# Altium schematic sheet 09_FTDI_USB.SchDoc
size A3; SheetNumber: 4; SheetTotal: 21
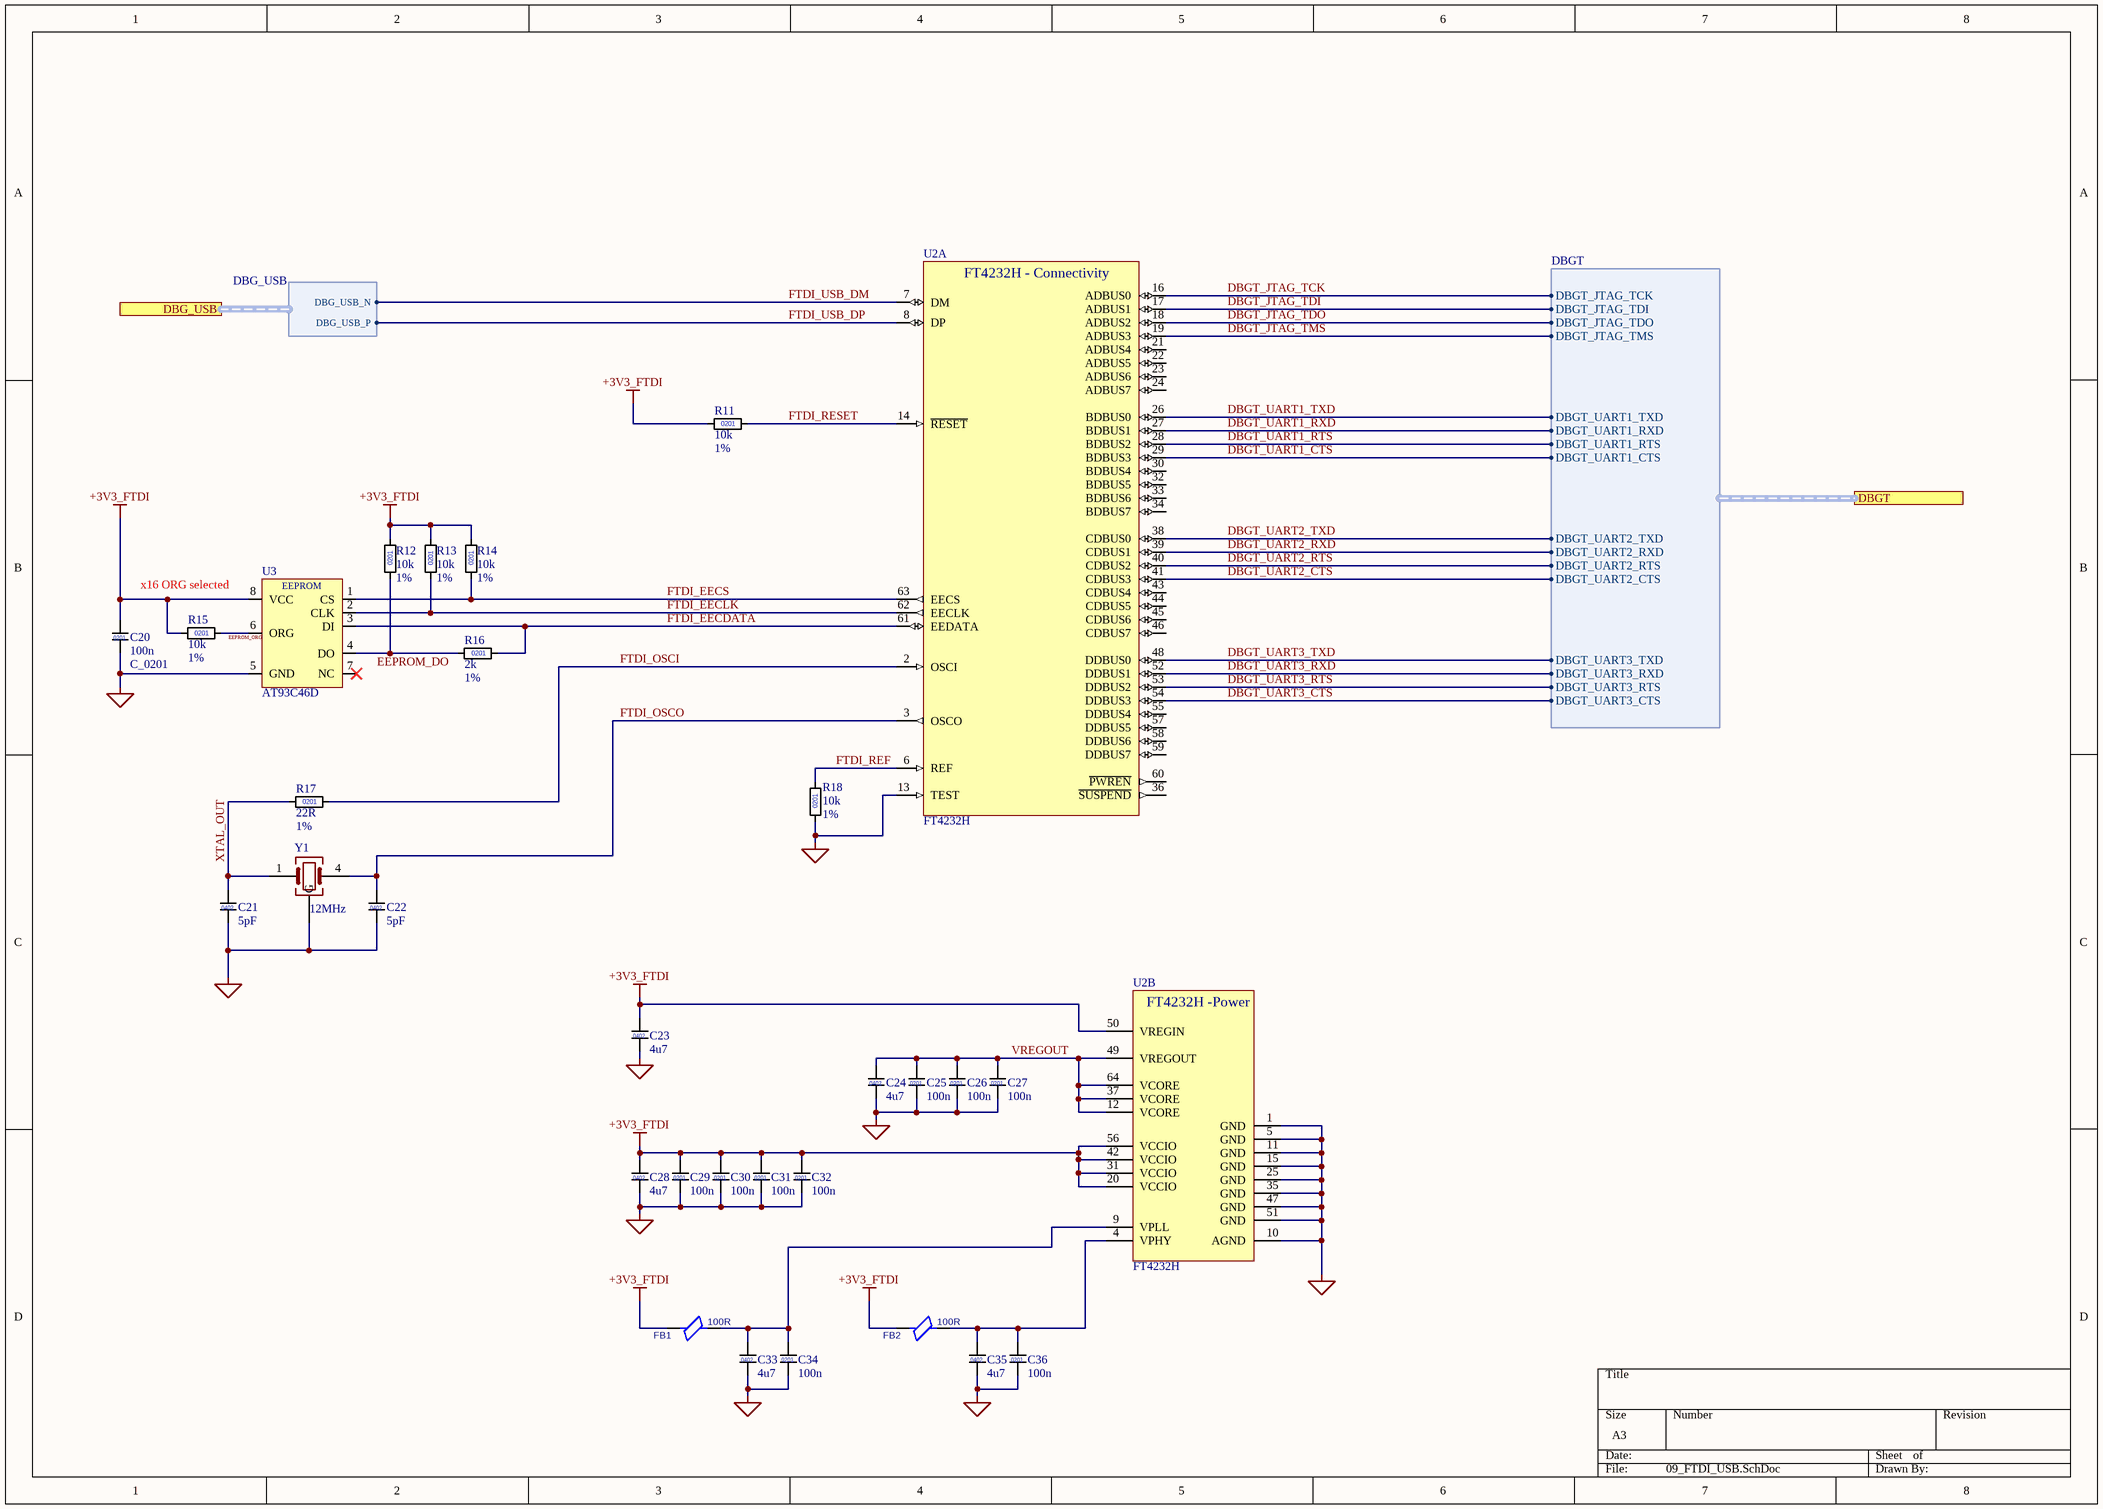
[diagram p0: 09_FTDI_USB.SchDoc]

## Parts
C20  C_0201  value 100n  [C0201]
C21  value 5pF  [C0201]  (hidden comment: C_0201)
C22  value 5pF  [C0201]  (hidden comment: C_0201)
C23  value 4u7  [C0402]  (hidden comment: C_0402)
C24  value 4u7  [C0402]  (hidden comment: C_0402)
C25  value 100n  [C0201]  (hidden comment: C_0201)
C26  value 100n  [C0201]  (hidden comment: C_0201)
C27  value 100n  [C0201]  (hidden comment: C_0201)
C28  value 4u7  [C0402]  (hidden comment: C_0402)
C29  value 100n  [C0201]  (hidden comment: C_0201)
C30  value 100n  [C0201]  (hidden comment: C_0201)
C31  value 100n  [C0201]  (hidden comment: C_0201)
C32  value 100n  [C0201]  (hidden comment: C_0201)
C33  value 4u7  [C0402]  (hidden comment: C_0402)
C34  value 100n  [C0201]  (hidden comment: C_0201)
C35  value 4u7  [C0402]  (hidden comment: C_0402)
C36  value 100n  [C0201]  (hidden comment: C_0201)
FB1  value 100R  [FB0201]  (hidden comment: FB_0201)
FB2  value 100R  [FB0201]  (hidden comment: FB_0201)
R11  value 10k  Tolerance: 1%  [R0201]  (hidden comment: 0201)
R12  value 10k  Tolerance: 1%  [R0201]  (hidden comment: 0201)
R13  value 10k  Tolerance: 1%  [R0201]  (hidden comment: 0201)
R14  value 10k  Tolerance: 1%  [R0201]  (hidden comment: 0201)
R15  value 10k  Tolerance: 1%  [R0201]  (hidden comment: 0201)
R16  value 2k  Tolerance: 1%  [R0201]  (hidden comment: 0201)
R17  value 22R  Tolerance: 1%  [R0201]  (hidden comment: 0201)
R18  value 10k  Tolerance: 1%  [R0201]  (hidden comment: 0201)
U2  FT4232H  [LQFP-64_10x10mm_P0.5mm]  (parts A,B of 2)
U3  AT93C46D
Y1  12MHz

## Ports
DBG_USB (harness DBG_USB), DBGT (harness DBGT, see SBC_SCH[2B], Voltage_Translator[1B])

## Harnesses
DBGT: DBGT_JTAG_TCK, DBGT_JTAG_TDI, DBGT_JTAG_TDO, DBGT_JTAG_TMS, DBGT_UART1_TXD, DBGT_UART1_RXD, DBGT_UART1_RTS, DBGT_UART1_CTS, DBGT_UART2_TXD, DBGT_UART2_RXD, DBGT_UART2_RTS, DBGT_UART2_CTS, DBGT_UART3_TXD, DBGT_UART3_RXD, DBGT_UART3_RTS, DBGT_UART3_CTS
DBG_USB: DBG_USB_N, DBG_USB_P

## Nets
+3V3_FTDI: C20.1 C23.1 C28.1 C29.1 C30.1 C31.1 C32.1 FB1.1 FB2.1 R11.1 R12.R? R13.R? R14.R? R15.1 U2.20(VCCIO) U2.31(VCCIO) U2.42(VCCIO) U2.50(VREGIN) U2.56(VCCIO) U3.8(VCC)
GND: C20.2 C21.2 C22.2 C23.2 C24.2 C25.2 C26.2 C27.2 C28.2 C29.2 C30.2 C31.2 C32.2 C33.2 C34.2 C35.2 C36.2 R18.1 U2.1(GND) U2.5(GND) U2.10(AGND) U2.11(GND) U2.13(TEST) U2.15(GND) U2.25(GND) U2.35(GND) U2.47(GND) U2.51(GND) U3.5(GND) Y1.2,3(G)
DBGT_JTAG_TCK: U2.16(ADBUS0) ; port DBGT.DBGT_JTAG_TCK
DBGT_JTAG_TDI: U2.17(ADBUS1) ; port DBGT.DBGT_JTAG_TDI
DBGT_JTAG_TDO: U2.18(ADBUS2) ; port DBGT.DBGT_JTAG_TDO
DBGT_JTAG_TMS: U2.19(ADBUS3) ; port DBGT.DBGT_JTAG_TMS
DBGT_UART1_CTS: U2.29(BDBUS3) ; port DBGT.DBGT_UART1_CTS
DBGT_UART1_RTS: U2.28(BDBUS2) ; port DBGT.DBGT_UART1_RTS
DBGT_UART1_RXD: U2.27(BDBUS1) ; port DBGT.DBGT_UART1_RXD
DBGT_UART1_TXD: U2.26(BDBUS0) ; port DBGT.DBGT_UART1_TXD
DBGT_UART2_CTS: U2.41(CDBUS3) ; port DBGT.DBGT_UART2_CTS
DBGT_UART2_RTS: U2.40(CDBUS2) ; port DBGT.DBGT_UART2_RTS
DBGT_UART2_RXD: U2.39(CDBUS1) ; port DBGT.DBGT_UART2_RXD
DBGT_UART2_TXD: U2.38(CDBUS0) ; port DBGT.DBGT_UART2_TXD
DBGT_UART3_CTS: U2.54(DDBUS3) ; port DBGT.DBGT_UART3_CTS
DBGT_UART3_RTS: U2.53(DDBUS2) ; port DBGT.DBGT_UART3_RTS
DBGT_UART3_RXD: U2.52(DDBUS1) ; port DBGT.DBGT_UART3_RXD
DBGT_UART3_TXD: U2.48(DDBUS0) ; port DBGT.DBGT_UART3_TXD
EEPROM_DO: R12.1 R16.1 U3.4(DO)
EEPROM_ORG: R15.R? U3.6(ORG)
FTDI_EECDATA: R16.R? U2.61(EEDATA) U3.3(DI)
FTDI_EECLK: R13.1 U2.62(EECLK) U3.2(CLK)
FTDI_EECS: R14.1 U2.63(EECS) U3.1(CS)
FTDI_OSCI: R17.R? U2.2(OSCI)
FTDI_OSCO: C22.1 U2.3(OSCO) Y1.4
FTDI_REF: R18.R? U2.6(REF)
FTDI_RESET: R11.R? U2.14(~{RESET})
FTDI_USB_DM: U2.7(DM) ; port DBG_USB.DBG_USB_N
FTDI_USB_DP: U2.8(DP) ; port DBG_USB.DBG_USB_P
VREGOUT: C24.1 C25.1 C26.1 C27.1 U2.12(VCORE) U2.37(VCORE) U2.49(VREGOUT) U2.64(VCORE)
XTAL_OUT: C21.1 R17.1 Y1.1
NetC33_1: C33.1 C34.1 FB1.2 U2.9(VPLL)
NetC35_1: C35.1 C36.1 FB2.2 U2.4(VPHY)

Not connected (* = marked no-connect by the designer): U2 21(ADBUS4) 22(ADBUS5) 23(ADBUS6) 24(ADBUS7) 30(BDBUS4) 32(BDBUS5) 33(BDBUS6) 34(BDBUS7) 36(~{SUSPEND}) 43(CDBUS4) 44(CDBUS5) 45(CDBUS6) 46(CDBUS7) 55(DDBUS4) 57(DDBUS5) 58(DDBUS6) 59(DDBUS7) 60(~{PWREN}); U3 7(NC)*

## Notes on the sheet
- x16 ORG selected
- (in symbol AT93C46D) EEPROM
- (in symbol C_0201) 0402; 0201
- (in symbol C_0402) 0402
- (in symbol FT4232H, part A) FT4232H - Connectivity
- (in symbol FT4232H, part B) FT4232H -Power

## Library data of the parts
C20-C22 C25-C27 C29-C32 C34 C36 = C_0201: MLCC 0201; Manufacturer_Name: *; Manufacturer_Part_Number: *
C23 C24 C28 C33 C35 = C_0402: MLCC 0402; Manufacturer_Name: *; Manufacturer_Part_Number: *
R11-R18 = R_0201: Manufacturer_Name: *; Manufacturer_Part_Number: *
U2 = FT4232H: Hi Speed Quad Channel USB UART/FIFO, LQFP/QFN-64; Datasheet: https://www.ftdichip.com/Support/Documents/DataSheets/ICs/DS_FT4232H.pdf; ComponentLink1Description: Datasheet; ComponentLink1URL: https://www.ftdichip.com/Support/Documents/DataSheets/ICs/DS_FT4232H.pdf; Manufacturer_Name: *; Manufacturer_Part_Number: *
Y1 = Crystal_GND23: Four pin crystal, GND on pins 2 and 3; private: KLC_S4.1
FB1 FB2 = FB_0201: Parameter 1: *